# Altium project 2812.PrjPcb
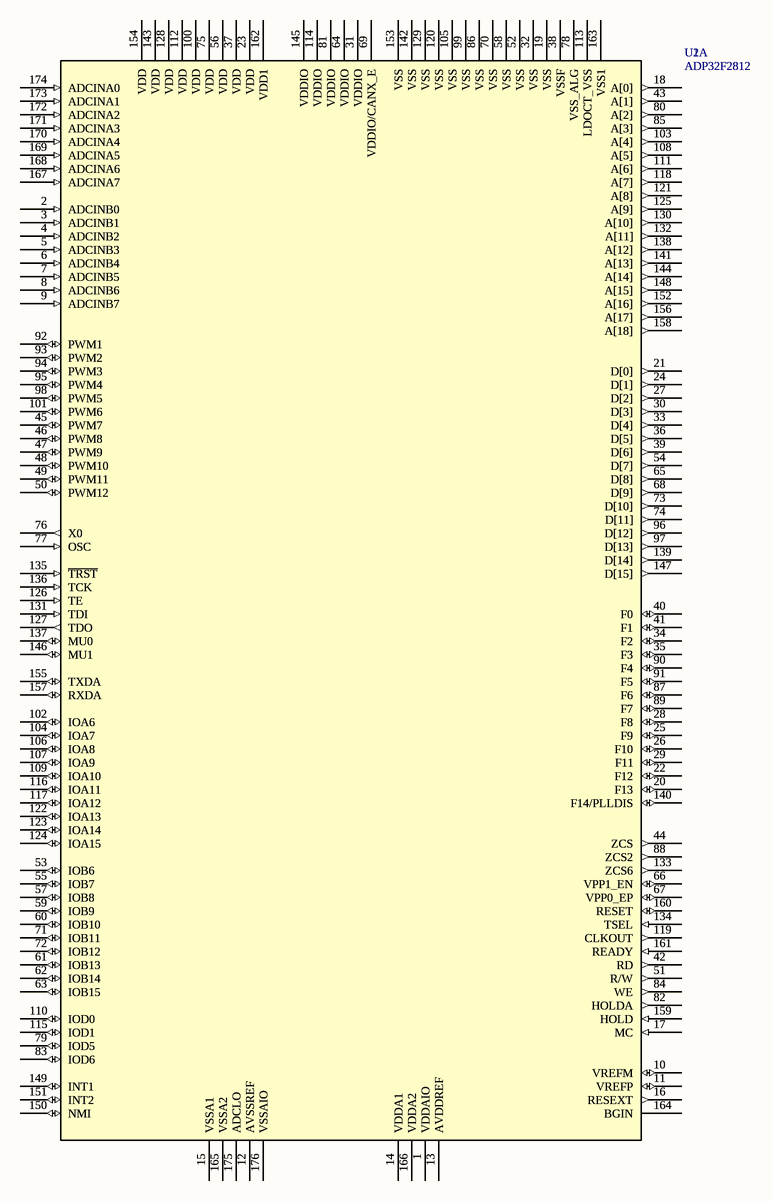
[diagram p0: project_2812.SchDoc]
1 sheet, 2 parts. Net scope: global (net labels, ports and power ports of the same name join across sheets).
Board file: AVP32F335-V1.1.PcbDoc

## Sheet project_2812.SchDoc
size A3

### Parts
U1  ADP32F2812  [AVP32F335]  (part A of 2)
U2  ADP32F2812  [OTQ-176-0.5-10a]  (part A of 2)

### Nets
NetU1_1: U1.1(VDDAIO) U2.1(VDDAIO)
NetU1_2: U1.2(ADCINB0) U2.2(ADCINB0)
NetU1_3: U1.3(ADCINB1) U2.3(ADCINB1)
NetU1_4: U1.4(ADCINB2) U2.4(ADCINB2)
NetU1_5: U1.5(ADCINB3) U2.5(ADCINB3)
NetU1_6: U1.6(ADCINB4) U2.6(ADCINB4)
NetU1_7: U1.7(ADCINB5) U2.7(ADCINB5)
NetU1_8: U1.8(ADCINB6) U2.8(ADCINB6)
NetU1_9: U1.9(ADCINB7) U2.9(ADCINB7)
NetU1_10: U1.10(VREFM) U2.10(VREFM)
NetU1_11: U1.11(VREFP) U2.11(VREFP)
NetU1_12: U1.12(AVSSREF) U2.12(AVSSREF)
NetU1_13: U1.13(AVDDREF) U2.13(AVDDREF)
NetU1_14: U1.14(VDDA1) U2.14(VDDA1)
NetU1_15: U1.15(VSSA1) U2.15(VSSA1)
NetU1_16: U1.16(RESEXT) U2.16(RESEXT)
NetU1_17: U1.17(MC) U2.17(MC)
NetU1_18: U1.18(A[0]) U2.18(A[0])
NetU1_19: U1.19(VSS) U2.19(VSS)
NetU1_20: U1.20(F13) U2.20(F13)
NetU1_21: U1.21(D[0]) U2.21(D[0])
NetU1_22: U1.22(F12) U2.22(F12)
NetU1_23: U1.23(VDD) U2.23(VDD)
NetU1_24: U1.24(D[1]) U2.24(D[1])
NetU1_25: U1.25(F9) U2.25(F9)
NetU1_26: U1.26(F10) U2.26(F10)
NetU1_27: U1.27(D[2]) U2.27(D[2])
NetU1_28: U1.28(F8) U2.28(F8)
NetU1_29: U1.29(F11) U2.29(F11)
NetU1_30: U1.30(D[3]) U2.30(D[3])
NetU1_31: U1.31(VDDIO) U2.31(VDDIO)
NetU1_32: U1.32(VSS) U2.32(VSS)
NetU1_33: U1.33(D[4]) U2.33(D[4])
NetU1_34: U1.34(F2) U2.34(F2)
NetU1_35: U1.35(F3) U2.35(F3)
NetU1_36: U1.36(D[5]) U2.36(D[5])
NetU1_37: U1.37(VDD) U2.37(VDD)
NetU1_38: U1.38(VSSF) U2.38(VSSF)
NetU1_39: U1.39(D[6]) U2.39(D[6])
NetU1_40: U1.40(F0) U2.40(F0)
NetU1_41: U1.41(F1) U2.41(F1)
NetU1_42: U1.42(RD) U2.42(RD)
NetU1_43: U1.43(A[1]) U2.43(A[1])
NetU1_44: U1.44(ZCS) U2.44(ZCS)
NetU1_45: U1.45(PWM7) U2.45(PWM7)
NetU1_46: U1.46(PWM8) U2.46(PWM8)
NetU1_47: U1.47(PWM9) U2.47(PWM9)
NetU1_48: U1.48(PWM10) U2.48(PWM10)
NetU1_49: U1.49(PWM11) U2.49(PWM11)
NetU1_50: U1.50(PWM12) U2.50(PWM12)
NetU1_51: U1.51(R/W) U2.51(R/W)
NetU1_52: U1.52(VSS) U2.52(VSS)
NetU1_53: U1.53(IOB6) U2.53(IOB6)
NetU1_54: U1.54(D[7]) U2.54(D[7])
NetU1_55: U1.55(IOB7) U2.55(IOB7)
NetU1_56: U1.56(VDD) U2.56(VDD)
NetU1_57: U1.57(IOB8) U2.57(IOB8)
NetU1_58: U1.58(VSS) U2.58(VSS)
NetU1_59: U1.59(IOB9) U2.59(IOB9)
NetU1_60: U1.60(IOB10) U2.60(IOB10)
NetU1_61: U1.61(IOB13) U2.61(IOB13)
NetU1_62: U1.62(IOB14) U2.62(IOB14)
NetU1_63: U1.63(IOB15) U2.63(IOB15)
NetU1_64: U1.64(VDDIO) U2.64(VDDIO)
NetU1_65: U1.65(D[8]) U2.65(D[8])
NetU1_66: U1.66(VPP1_EN) U2.66(VPP1_EN)
NetU1_67: U1.67(VPP0_EP) U2.67(VPP0_EP)
NetU1_68: U1.68(D[9]) U2.68(D[9])
NetU1_69: U1.69(VDDIO/CANX_E) U2.69(VDDIO/CANX_E)
NetU1_70: U1.70(VSS) U2.70(VSS)
NetU1_71: U1.71(IOB11) U2.71(IOB11)
NetU1_72: U1.72(IOB12) U2.72(IOB12)
NetU1_73: U1.73(D[10]) U2.73(D[10])
NetU1_74: U1.74(D[11]) U2.74(D[11])
NetU1_75: U1.75(VDD) U2.75(VDD)
NetU1_76: U1.76(X0) U2.76(X0)
NetU1_77: U1.77(OSC) U2.77(OSC)
NetU1_78: U1.78(VSS_ALG) U2.78(VSS_ALG)
NetU1_79: U1.79(IOD5) U2.79(IOD5)
NetU1_80: U1.80(A[2]) U2.80(A[2])
NetU1_81: U1.81(VDDIO) U2.81(VDDIO)
NetU1_82: U1.82(HOLDA) U2.82(HOLDA)
NetU1_83: U1.83(IOD6) U2.83(IOD6)
NetU1_84: U1.84(WE) U2.84(WE)
NetU1_85: U1.85(A[3]) U2.85(A[3])
NetU1_86: U1.86(VSS) U2.86(VSS)
NetU1_87: U1.87(F6) U2.87(F6)
NetU1_88: U1.88(ZCS2) U2.88(ZCS2)
NetU1_89: U1.89(F7) U2.89(F7)
NetU1_90: U1.90(F4) U2.90(F4)
NetU1_91: U1.91(F5) U2.91(F5)
NetU1_92: U1.92(PWM1) U2.92(PWM1)
NetU1_93: U1.93(PWM2) U2.93(PWM2)
NetU1_94: U1.94(PWM3) U2.94(PWM3)
NetU1_95: U1.95(PWM4) U2.95(PWM4)
NetU1_96: U1.96(D[12]) U2.96(D[12])
NetU1_97: U1.97(D[13]) U2.97(D[13])
NetU1_98: U1.98(PWM5) U2.98(PWM5)
NetU1_99: U1.99(VSS) U2.99(VSS)
NetU1_100: U1.100(VDD) U2.100(VDD)
NetU1_101: U1.101(PWM6) U2.101(PWM6)
NetU1_102: U1.102(IOA6) U2.102(IOA6)
NetU1_103: U1.103(A[4]) U2.103(A[4])
NetU1_104: U1.104(IOA7) U2.104(IOA7)
NetU1_105: U1.105(VSS) U2.105(VSS)
NetU1_106: U1.106(IOA8) U2.106(IOA8)
NetU1_107: U1.107(IOA9) U2.107(IOA9)
NetU1_108: U1.108(A[5]) U2.108(A[5])
NetU1_109: U1.109(IOA10) U2.109(IOA10)
NetU1_110: U1.110(IOD0) U2.110(IOD0)
NetU1_111: U1.111(A[6]) U2.111(A[6])
NetU1_112: U1.112(VDD) U2.112(VDD)
NetU1_113: U1.113(LDOCT_VSS) U2.113(LDOCT_VSS)
NetU1_114: U1.114(VDDIO) U2.114(VDDIO)
NetU1_115: U1.115(IOD1) U2.115(IOD1)
NetU1_116: U1.116(IOA11) U2.116(IOA11)
NetU1_117: U1.117(IOA12) U2.117(IOA12)
NetU1_118: U1.118(A[7]) U2.118(A[7])
NetU1_119: U1.119(CLKOUT) U2.119(CLKOUT)
NetU1_120: U1.120(VSS) U2.120(VSS)
NetU1_121: U1.121(A[8]) U2.121(A[8])
NetU1_122: U1.122(IOA13) U2.122(IOA13)
NetU1_123: U1.123(IOA14) U2.123(IOA14)
NetU1_124: U1.124(IOA15) U2.124(IOA15)
NetU1_125: U1.125(A[9]) U2.125(A[9])
NetU1_126: U1.126(TE) U2.126(TE)
NetU1_127: U1.127(TDO) U2.127(TDO)
NetU1_128: U1.128(VDD) U2.128(VDD)
NetU1_129: U1.129(VSS) U2.129(VSS)
NetU1_130: U1.130(A[10]) U2.130(A[10])
NetU1_131: U1.131(TDI) U2.131(TDI)
NetU1_132: U1.132(A[11]) U2.132(A[11])
NetU1_133: U1.133(ZCS6) U2.133(ZCS6)
NetU1_134: U1.134(TSEL) U2.134(TSEL)
NetU1_135: U1.135(~{TRST}) U2.135(~{TRST})
NetU1_136: U1.136(TCK) U2.136(TCK)
NetU1_137: U1.137(MU0) U2.137(MU0)
NetU1_138: U1.138(A[12]) U2.138(A[12])
NetU1_139: U1.139(D[14]) U2.139(D[14])
NetU1_140: U1.140(F14/PLLDIS) U2.140(F14/PLLDIS)
NetU1_141: U1.141(A[13]) U2.141(A[13])
NetU1_142: U1.142(VSS) U2.142(VSS)
NetU1_143: U1.143(VDD) U2.143(VDD)
NetU1_144: U1.144(A[14]) U2.144(A[14])
NetU1_145: U1.145(VDDIO) U2.145(VDDIO)
NetU1_146: U1.146(MU1) U2.146(MU1)
NetU1_147: U1.147(D[15]) U2.147(D[15])
NetU1_148: U1.148(A[15]) U2.148(A[15])
NetU1_149: U1.149(INT1) U2.149(INT1)
NetU1_150: U1.150(NMI) U2.150(NMI)
NetU1_151: U1.151(INT2) U2.151(INT2)
NetU1_152: U1.152(A[16]) U2.152(A[16])
NetU1_153: U1.153(VSS) U2.153(VSS)
NetU1_154: U1.154(VDD) U2.154(VDD)
NetU1_155: U1.155(TXDA) U2.155(TXDA)
NetU1_156: U1.156(A[17]) U2.156(A[17])
NetU1_157: U1.157(RXDA) U2.157(RXDA)
NetU1_158: U1.158(A[18]) U2.158(A[18])
NetU1_159: U1.159(HOLD) U2.159(HOLD)
NetU1_160: U1.160(RESET) U2.160(RESET)
NetU1_161: U1.161(READY) U2.161(READY)
NetU1_162: U1.162(VDD1) U2.162(VDD1)
NetU1_163: U1.163(VSS1) U2.163(VSS1)
NetU1_164: U1.164(BGIN) U2.164(BGIN)
NetU1_165: U1.165(VSSA2) U2.165(VSSA2)
NetU1_166: U1.166(VDDA2) U2.166(VDDA2)
NetU1_167: U1.167(ADCINA7) U2.167(ADCINA7)
NetU1_168: U1.168(ADCINA6) U2.168(ADCINA6)
NetU1_169: U1.169(ADCINA5) U2.169(ADCINA5)
NetU1_170: U1.170(ADCINA4) U2.170(ADCINA4)
NetU1_171: U1.171(ADCINA3) U2.171(ADCINA3)
NetU1_172: U1.172(ADCINA2) U2.172(ADCINA2)
NetU1_173: U1.173(ADCINA1) U2.173(ADCINA1)
NetU1_174: U1.174(ADCINA0) U2.174(ADCINA0)
NetU1_175: U1.175(ADCLO) U2.175(ADCLO)
NetU1_176: U1.176(VSSAIO) U2.176(VSSAIO)

### Library data of the parts
U1 U2 = ADP32F2812: Mfr_Name: Texas Instruments; RefDes: RefDes; Type: Type